# Altium schematic sheet Iso_SMA_MCX_EXT_Channel.SchDoc: =DocumentName
size A4; Organization: Technosystem; Address1: Słoneczna 125, 05-506 Kolonia Lesznowola; Address2: https://technosystem.pl/; Address4: (NOT USED); DocumentNumber: 9; Revision: 0; SheetNumber: 9; SheetTotal: 9
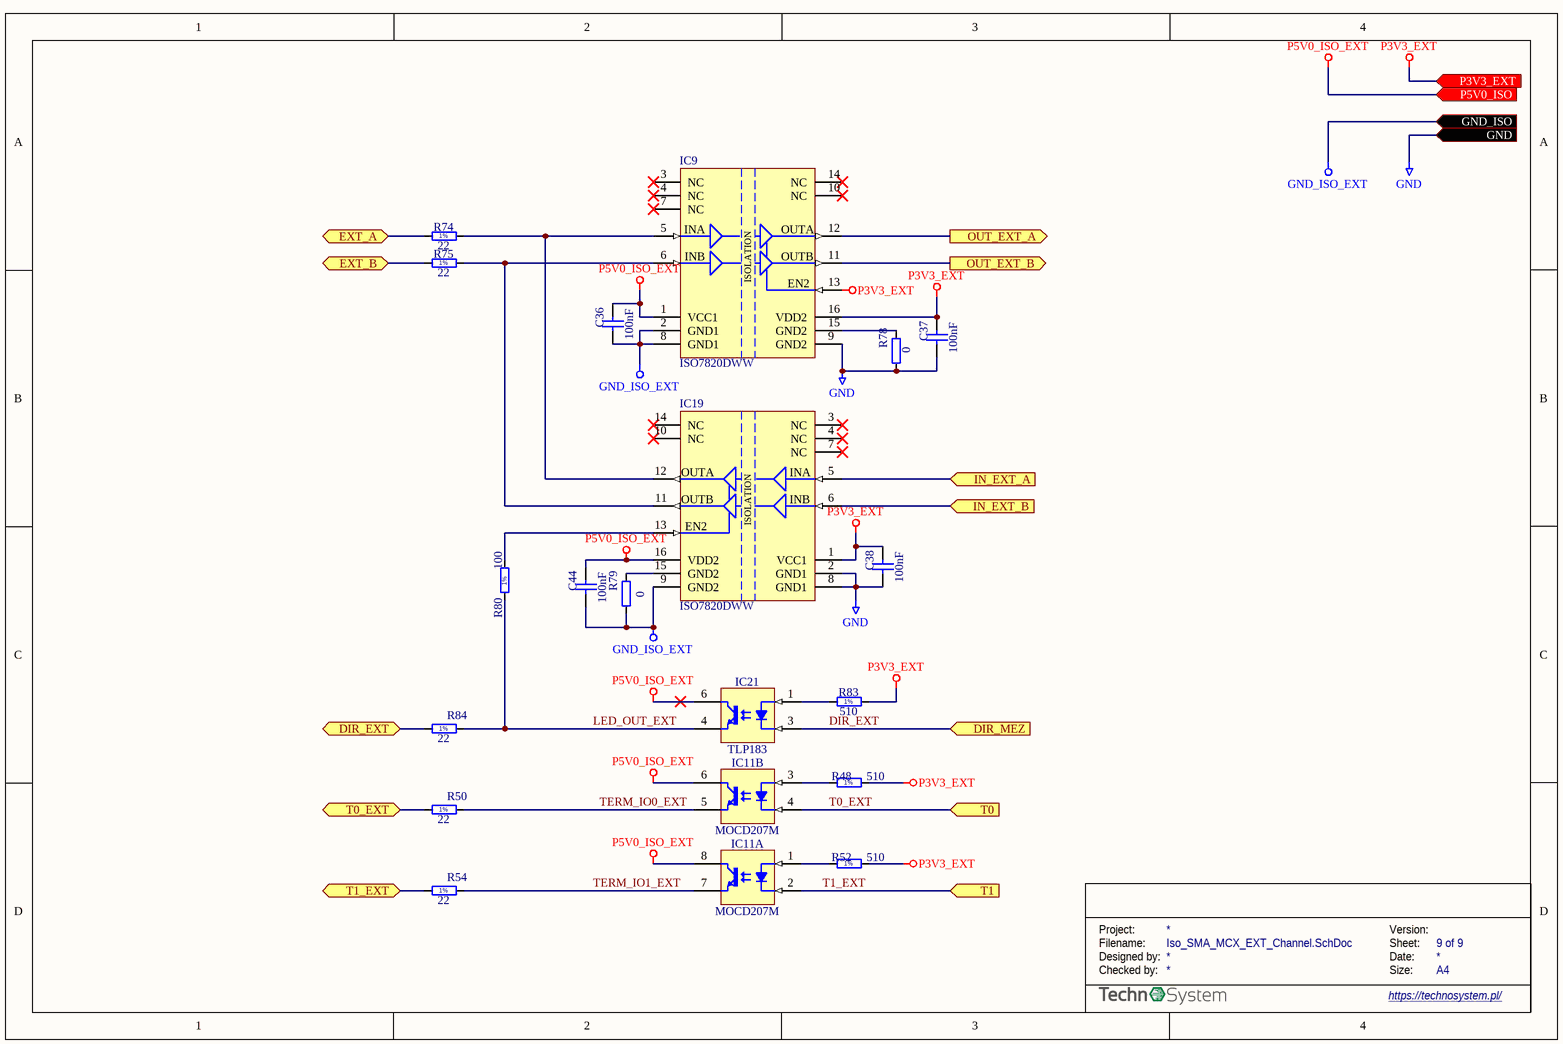
[diagram p0: Iso_SMA_MCX_EXT_Channel.SchDoc]

## Parts
C36  100nF  [CAPC1005X55N]
C37  100nF  [CAPC1005X55N]
C38  100nF  [CAPC1005X55N]
C44  100nF  [CAPC1005X55N]
IC9  ISO7820DWW  [SOIC127P1720X265-16N]
IC11  MOCD207M  [SOIC127P594X363-8N]  (parts A,B of 2)
IC19  ISO7820DWW  [SOIC127P1720X265-16N]
IC21  TLP183  [TOSHIBA_11-4M1S]
R48  510  [RESC1005X40N]
R50  22  [RESC1005X40N]
R52  510  [RESC1005X40N]
R54  22  [RESC1005X40N]
R74  22  [RESC1005X40N]
R75  22  [RESC1005X40N]
R78  0  [RESC1005X40N]
R79  0  [RESC1005X40N]
R80  100  [RESC1005X40N]
R83  510  [RESC1005X40N]
R84  22  [RESC1005X40N]

## Ports
DIR_EXT (bidir), DIR_MEZ (in), EXT_A (bidir), EXT_B (bidir), GND (in), GND_ISO (in), IN_EXT_A (in), IN_EXT_B (in), OUT_EXT_A (out), OUT_EXT_B (out), P3V3_EXT (in), P5V0_ISO (in), T0 (in), T0_EXT (bidir), T1 (in), T1_EXT (bidir)

## Nets
GND: C37.1 C38.1 IC9.9(GND2) IC19.2(GND1) IC19.8(GND1) R78.2 ; port GND
GND_ISO_EXT: C36.1 C44.1 IC9.2(GND1) IC9.8(GND1) IC19.9(GND2) R79.1 ; port GND_ISO
P3V3_EXT: C37.2 C38.2 IC9.13(EN2) IC9.16(VDD2) IC19.1(VCC1) R48.2 R52.2 R83.2 ; port P3V3_EXT
P5V0_ISO_EXT: C36.2 C44.2 IC9.1(VCC1) IC11.6(C) IC11.8(C) IC19.16(VDD2) IC21.6(C) ; port P5V0_ISO
DIR_EXT: R84.1 ; port DIR_EXT
DIR_EXT: IC21.3(C) ; port DIR_MEZ  [a separate net that carries the same name]
EXT_A: R74.1 ; port EXT_A
EXT_B: R75.1 ; port EXT_B
IN_EXT_A: IC19.5(INA) ; port IN_EXT_A
IN_EXT_B: IC19.6(INB) ; port IN_EXT_B
LED_OUT_EXT: IC21.4(E) R80.1 R84.2
OUT_EXT_A: IC9.12(OUTA) ; port OUT_EXT_A
OUT_EXT_B: IC9.11(OUTB) ; port OUT_EXT_B
T0_EXT: R50.1 ; port T0_EXT
T0_EXT: IC11.4(K) ; port T0  [a separate net that carries the same name]
T1_EXT: R54.1 ; port T1_EXT
T1_EXT: IC11.2(K) ; port T1  [a separate net that carries the same name]
TERM_IO0_EXT: IC11.5(E) R50.2
TERM_IO1_EXT: IC11.7(E) R54.2
NetIC9_5: IC9.5(INA) IC19.12(OUTA) R74.2
NetIC9_6: IC9.6(INB) IC19.11(OUTB) R75.2
NetIC9_15: IC9.15(GND2) R78.1
NetIC11_1: IC11.1(A) R52.1
NetIC11_3: IC11.3(A) R48.1
NetIC19_13: IC19.13(EN2) R80.2
NetIC19_15: IC19.15(GND2) R79.2
NetIC21_1: IC21.1(A) R83.1

Not connected (* = marked no-connect by the designer): IC9 3(NC)* 4(NC)* 7(NC)* 10(NC)* 14(NC)*; IC19 3(NC)* 4(NC)* 7(NC)* 10(NC)* 14(NC)*

## Notes on the sheet
- Project:
- Version:
- Designed by:
- Checked by:
- Filename:
- Size:
- Date:
- Sheet:
- A4
- (in symbol CMP-015-00012-2) ISOLATION
- (in symbol R0402_22R_1%_0.0625W_100PPM) 1%
- (in symbol R0402_100R_1%_0.1W_100PPM) 1%
- (in symbol R0402_510R_1%_0.0625W_100PPM) 1%

## Library data of the parts
C36-C38 C44 = CC0402_100NF_16V_10%_X5R: Non-polarised capacitor; Part Description: SMD Multilayer Chip Ceramic Capacitor; Manufacturer: GENERIC; Manufacturer1 Part Number: GRM155R61C104KA88D; Voltage: 16V; TC: X5R; Tolerance: ±10%; Part Number: CC0402_100NF_16V_10%_X5R; Component Kind: Standard; Component Type: Standard; Pin Count: 2; Value: 100nF; Status: None; Manufacturer Part Number: CC0402_100NF_16V_10%_X5R; Case: 0402; Mounted: Yes; Socket: No; SMD: Yes; Sense: No; Manufacturer1 Example: MURATA; Manufacturer1 ComponentHeight: 0.55mm; HelpURL: \\cern.ch\dfs\Applications\Altium\Datasheets\CC0402_X5R_MURATA_GRM.pdf; Author: CERN DEM JLC; CreateDate: 10.12.2013; LatestRevisionDate: 10.12.2013
IC9 IC19 = CMP-015-00012-2: Highest isolation rating, dual-channel, 2/0, reinforced digital isolator 16-SOIC -55 to 125; Manufacturer: Texas Instruments; Max Supply Voltage: 5.5V; Min Supply Voltage: 2.25V; Manufacturer Part Number: ISO7820DWW; Pins: 16; Min Operating Temperature: -55°C; Case/Package: SOIC; Max Operating Temperature: 125°C
IC11 = MOCD207M: Dual Optocoupler; Part Description: Dual-Channel Phototransistor Output Optocoupler; Manufacturer: ON SEMICONDUCTOR; PressFit: No; Bonding: No; Part Number: MOCD207M; Component Kind: Standard; Component Type: Standard; Device: MOCD207M; PackageDescription: SOIC, 1.27mm Pitch; 8 Pin, 3.91mm W X 4.88mm L, IPC Medium Density; Manufacturer Part Number: MOCD207M; Pin Count: 8; Case: SOIC8; Mounted: Yes; Socket: No; SMD: Yes; Sense: No; ComponentHeight: 3.63mm; HelpURL: \\cern.ch\dfs\Applications\Altium\Datasheets\MOCD207M.pdf; Author: CERN DEM JLC; CreateDate: 03.10.2017; LatestRevisionDate: 03.10.2017
IC21 = TLP183: Single Optocoupler; Part Description: Photocoupler InGaAs Infrared LED & Photo-Transistor; Manufacturer: TOSHIBA; PressFit: No; Bonding: No; Part Number: TLP183; Component Kind: Standard; Component Type: Standard; Device: TLP183; PackageDescription: SOIC, 1.27mm Pitch; 4 Pin, TOSHIBA Case (5mm Creepage); Manufacturer Part Number: TLP183; Pin Count: 4; Case: SOIC4; Mounted: Yes; Socket: No; SMD: Yes; Sense: No; ComponentHeight: 2.3mm; HelpURL: \\cern.ch\dfs\Applications\Altium\Datasheets\TLP183.pdf; Author: CERN DEM JMW; CreateDate: 05.10.2015; LatestRevisionDate: 04.09.2017
R48 R52 R83 = R0402_510R_1%_0.0625W_100PPM: Resistor - 1%; Part Description: General Purpose Thick Film Chip Resistor; Manufacturer: GENERIC; Manufacturer1 Part Number: 232270675101L; TC: ±100ppm/°C; Part Number: R0402_510R_1%_0.0625W_100PPM; Component Kind: Standard; Component Type: Standard; Pin Count: 2; Value: 510; Status: Not recommended; Power: 0.0625W; Tolerance: ±1%; Manufacturer Part Number: R0402_510R_1%_0.0625W_100PPM; Case: 0402; Mounted: Yes; Sense: No; Socket: No; SMD: Yes; Manufacturer1 Example: YAGEO PHYCOMP; Manufacturer1 ComponentHeight: 0.4mm; HelpURL: \\cern.ch\dfs\Applications\Altium\Datasheets\R0402_Phycomp_RC0402.pdf; Author: CERN DEM JLC; CreateDate: 03.12.2007; LatestRevisionDate: 17.10.2012
R50 R54 R74 R75 R84 = R0402_22R_1%_0.0625W_100PPM: Resistor - 1%; Part Description: General Purpose Thick Film Chip Resistor; Manufacturer: GENERIC; Manufacturer1 Part Number: 232270672209L; TC: ±100ppm/°C; PressFit: No; Part Number: R0402_22R_1%_0.0625W_100PPM; Component Kind: Standard; Component Type: Standard; Pin Count: 2; Value: 22; Status: Not Recommended; Power: 0.0625W; Tolerance: ±1%; Manufacturer Part Number: R0402_22R_1%_0.0625W_100PPM; Case: 0402; Mounted: Yes; Sense: No; Socket: No; SMD: Yes; Manufacturer1 Example: YAGEO PHYCOMP; Manufacturer1 ComponentHeight: 0.4mm; HelpURL: \\cern.ch\dfs\Applications\Altium\Datasheets\R0402_Phycomp_RC0402.pdf; Author: CERN DEM JLC; CreateDate: 03.12.2007; LatestRevisionDate: 17.10.2012
R78 R79 = R0402_0R_JUMPER: Resistor; Part Description: 1A (0.05R Max DC Resistance) Zero Ohm Jumper; Manufacturer: GENERIC; Manufacturer1 Part Number: 232270591001L; PressFit: No; Part Number: R0402_0R_JUMPER; Component Kind: Standard; Component Type: Standard; Pin Count: 2; Value: 0; Status: Not Recommended; Manufacturer Part Number: R0402_0R_JUMPER; Case: 0402; Mounted: Yes; Sense: No; Socket: No; SMD: Yes; Manufacturer1 Example: YAGEO PHYCOMP; Manufacturer1 ComponentHeight: 0.4mm; HelpURL: \\cern.ch\dfs\Applications\Altium\Datasheets\R0402_Phycomp_RC0402.pdf; Author: CERN DEM JLC; CreateDate: 03.12.2007; LatestRevisionDate: 17.10.2012
R80 = R0402_100R_1%_0.1W_100PPM: Resistor - 1%; Part Description: General Purpose Thick Film Chip Resistor; Manufacturer: GENERIC; Manufacturer Part Number: R0402_100R_1%_0.1W_100PPM_50V; Manufacturer1 Part Number: ERJ2RKF1000X; Power: 0.1W; TC: ±100ppm/°C; Voltage: 50V; Part Number: R0402_100R_1%_0.1W_100PPM; Component Kind: Standard; Component Type: Standard; Pin Count: 2; Value: 100; Status: Not recommended; Tolerance: ±1%; Case: 0402; Mounted: Yes; Sense: No; Socket: No; SMD: Yes; Manufacturer1 Example: PANASONIC; Manufacturer1 ComponentHeight: 0.4mm; HelpURL: \\cern.ch\dfs\Applications\Altium\Datasheets\R0402_PANASONIC_ERJ2RK.pdf; Author: CERN DEM JLC; CreateDate: 12.12.2013; LatestRevisionDate: 03.03.2015